# Altium schematic sheet IO_Connectors.SchDoc
size A4; SheetNumber: 2; SheetTotal: 17
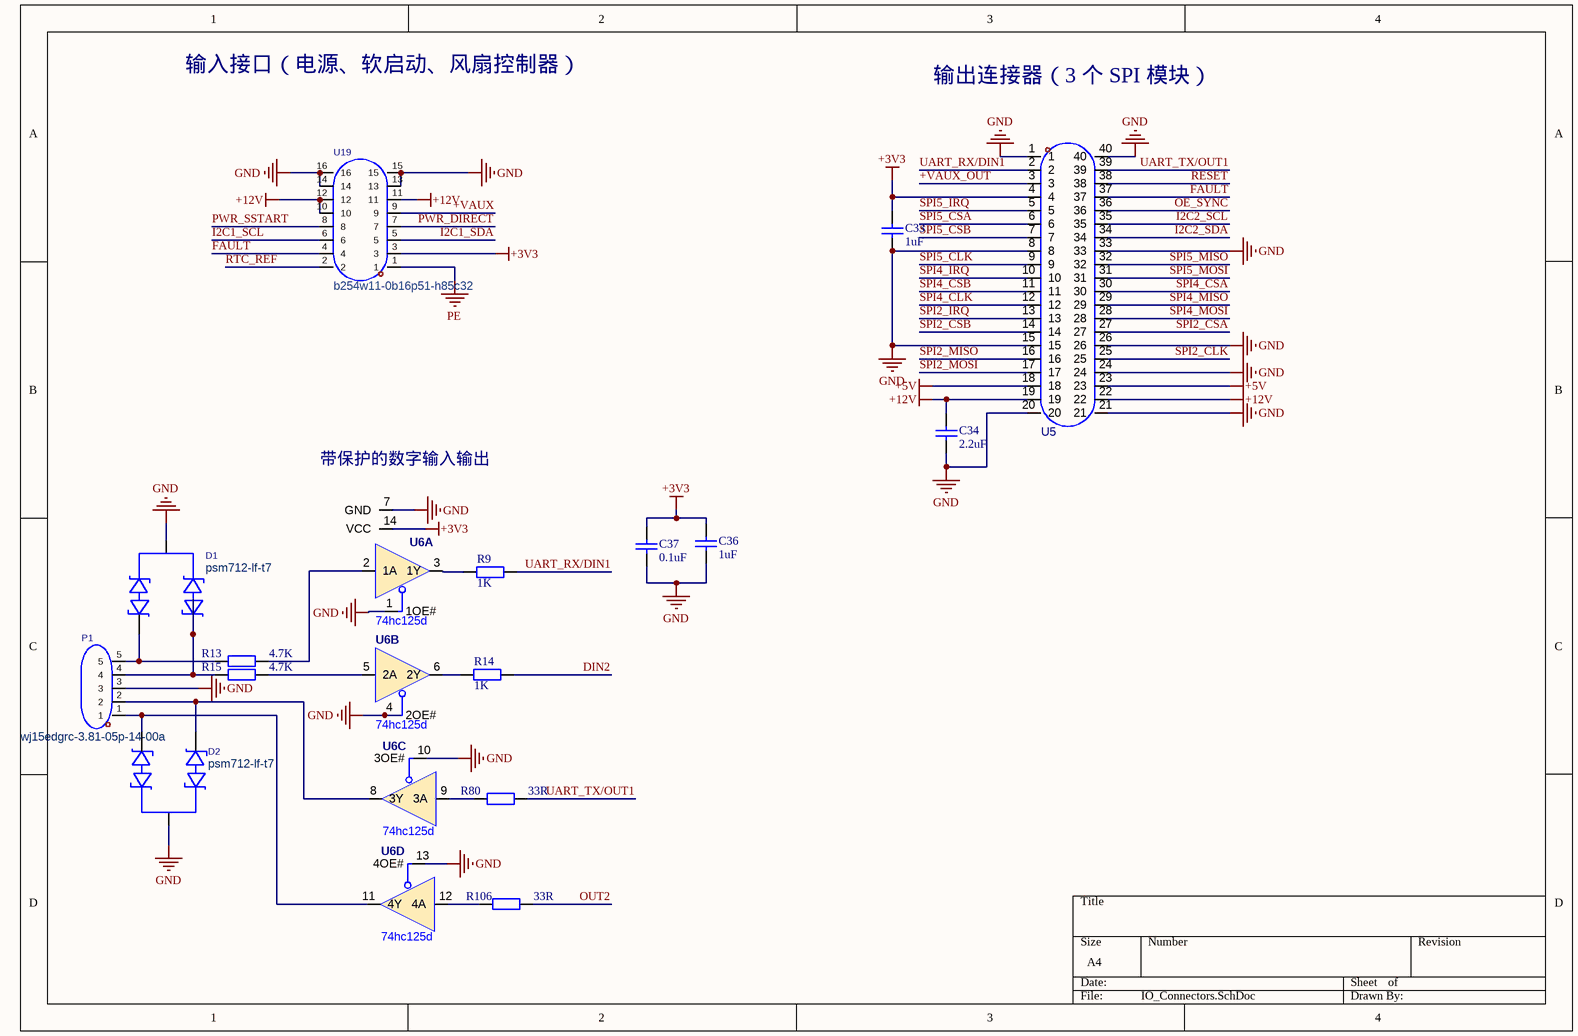
[diagram p0: IO_Connectors.SchDoc]

## Parts
C33  1uF  [C0603]
C34  2.2uF  [C0603]
C36  1uF  [C0603]
C37  0.1uF  [C0603]
D1  psm712-lf-t7  [SOT-23-3_L3.0-W1.7-P0.95-LS2.9-BR]
D2  psm712-lf-t7  [SOT-23-3_L3.0-W1.7-P0.95-LS2.9-BR]
P1  wj15edgrc-3.81-05p-14-00a  [CONN-TH_5P-P3.81_WJ15EDGRC-3.81-5P]
R9  1K  [R0603]
R13  4.7K  [R0603]
R14  1K  [R0603]
R15  4.7K  [R0603]
R80  33R  [R0603]
R106  33R  [R0603]
U5  ds1024-2x20r2  [HDR-TH_40P-P2.54-H-F-R2-C20-S2.54-W8.5]  (value not drawn)
U6  74hc125d  [SOIC-14_L8.7-W3.9-P1.27-LS6.0-BL]  (parts A,B,C,D of 4)
U19  b254w11-0b16p51-h85c32  [HDR-TH_16P-P2.54-H-F-R2-C8-W8.5]

## Nets
+3V3: C33.1 C36.2 C37.2 U5.4 U6.14(VCC) U19.3
+5V: U5.18 U5.23
+12V: C34.2 U5.19 U5.22 U19.10 U19.11 U19.12
GND: C33.2 C34.1 C36.1 C37.1 D1.3(K) D2.3(K) P1.3 U5.1 U5.8 U5.15 U5.20 U5.21 U5.24 U5.26 U5.33 U5.40 U6.1(1OE#) U6.4(2OE#) U6.7(GND) U6.10(3OE#) U6.13(4OE#) U19.13 U19.14 U19.15 U19.16
PE: U19.1
+VAUX: U19.9
+VAUX_OUT: U5.3
DIN2: R14.1
FAULT: U5.37 U19.4
I2C1_SCL: U19.6
I2C1_SDA: U19.5
I2C2_SCL: U5.35
I2C2_SDA: U5.34
OE_SYNC: U5.36
OUT2: R106.2
PWR_DIRECT: U19.7
PWR_SSTART: U19.8
RESET: U5.38
RTC_REF: U19.2
SPI2_CLK: U5.25
SPI2_CSA: U5.27
SPI2_CSB: U5.14
SPI2_IRQ: U5.13
SPI2_MISO: U5.16
SPI2_MOSI: U5.17
SPI4_CLK: U5.12
SPI4_CSA: U5.30
SPI4_CSB: U5.11
SPI4_IRQ: U5.10
SPI4_MISO: U5.29
SPI4_MOSI: U5.28
SPI5_CLK: U5.9
SPI5_CSA: U5.6
SPI5_CSB: U5.7
SPI5_IRQ: U5.5
SPI5_MISO: U5.32
SPI5_MOSI: U5.31
UART_RX/DIN1: R9.1 U5.2
UART_TX/OUT1: R80.2 U5.39
NetD1_1: D1.1(A1) P1.5 R13.1
NetD1_2: D1.2(A1) P1.4 R15.1
NetD2_1: D2.1(A1) P1.2 U6.8(3Y)
NetD2_2: D2.2(A1) P1.1 U6.11(4Y)
NetR9_2: R9.2 U6.3(1Y)
NetR13_2: R13.2 U6.2(1A)
NetR14_2: R14.2 U6.6(2Y)
NetR15_2: R15.2 U6.5(2A)
NetR80_1: R80.1 U6.9(3A)
NetR106_1: R106.1 U6.12(4A)

## Notes on the sheet
- 输入接口（电源、软启动、风扇控制器）
- 输出连接器（3 个 SPI 模块）
- (near U6) 带保护的数字输入输出

## Library data of the parts
C33 C34 C36 C37 = C0603: Capacitor; Value: 104; Published: 8-Jun-2000; LatestRevisionDate: 17-Jul-2002; LatestRevisionNote: Re-released for DXP Platform.; Publisher: Altium Limited
D1 D2 = psm712-lf-t7: 极性:单向;反向截止电压(Vrwm):12V;钳位电压:19V;峰值脉冲电流(Ipp):34A@8/20us；30A@8/20us;峰值脉冲功率(Ppp):600W@8/20us;击穿电压(VBR):13.3V;; Manufacturer: PROTEK; AddInBom: yes; ModelId: 89cb27a44ab2466697082bb9fd73a7d0; ModelName: SOT-23-3L_L2.9-W1.6-H1.1-LS2.8-P0.95; ModelTransform: 114.173,110.236,0,90,0,0,0,0,0; Polarity: 单向; Reverse Stand-Off Voltage (Vrwm): 12V; Clamping Voltage: 19V; Voltage - Breakdown: 13.3V; Reverse Leakage Current (Ir): 1uA；20uA; level of protection: IEC 61000-4-4；IEC 61000-4-5；IEC 61000-4-2; Type: TVS; Junction Capacitance: 75pF; Symbol: PSM712-LF-T7; LCSC Part Name: 单向TVS 12V截止 峰值浪涌电流：34A@8/20us 30A@8/20us; SupplierPart: C32677; ManufacturerPart: PSM712-LF-T7; Supplier Footprint: SOT-23; JLCPCB Part Class: Basic Part; Datasheet: https://item.szlcsc.com/datasheet/PSM712-LF-T7/33642.html; Supplier: LCSC; ConvertToPcb: yes; FootprintName: SOT-23-3_L3.0-W1.7-P0.95-LS2.9-BR; Peak Pulse Current (Ipp): 34A@8/20us；30A@8/20us; Peak Pulse Power Dissipation (Ppp): 600W@8/20us; Operating Temperature: -55℃~+150℃
P1 = wj15edgrc-3.81-05p-14-00a: 连接器类型:板端/插座-闭口;固定方式:无固定装置;结构:1x5P;间距:3.81mm;颜色:绿色;安装方式:弯插;排数:1;每排PIN数:5;额定电流:8A;额定电压:300V;线规 - AWG:-;线规 - 平方毫米:-;工作温度:-40℃~+105℃;; Manufacturer: KANGNEX(康奈克斯电气); Symbol: WJ15EDGRC-3.81-5P; AddInBom: yes; ModelId: 1f5bfc586d7a497a94e16b2138b9ad12; ModelName: CONN-TH_WJ3.81-WI-5P; ModelTransform: 784.64406,360.2355,0,0,0,0,-0.197,-118.11,-137.795; Number of Positions or Pins: 1x5P; Pitch: 3.81mm; Number of PINs Per Row: 5; Current Rating: 8A; Voltage Rating (Max): 300V; LCSC Part Name: 无固定装置 1x5P 3.81mm 排数:1 每排P数:5; SupplierPart: C8395; ManufacturerPart: WJ15EDGRC-3.81-05P-14-00A; Supplier Footprint: 弯插,P=3.81mm; JLCPCB Part Class: Extended Part; Datasheet: https://item.szlcsc.com/datasheet/WJ15EDGRC-3.81-05P-14-00A/8889.html; Supplier: LCSC; ConvertToPcb: yes; FootprintName: CONN-TH_5P-P3.81_WJ15EDGRC-3.81-5P; Connector Type: 板端/插座-闭口; Termination Style: 无固定装置; Color: 绿色; Mounting Type: 弯插; Number of Pins: 5P; Number of Rows: 1; Wire Gauge - AWG: -; Wire Gauge - mm2: -; Operating Temperature: -40℃~+105℃; Connection Type: -; Outlet Direction (Vertical Basis): -
R9 R13-R15 R80 R106 = R0603: Resistor; Published: 8-Jun-2000; LatestRevisionDate: 17-Jul-2002; LatestRevisionNote: Re-released for DXP Platform.; Publisher: Altium Limited
U5 = ds1024-2x20r2: 插孔结构:2x20P;间距:2.54mm;行距:2.54mm;圆孔/方孔:方孔;安装方式:弯插;排数:双排;总孔位数:40P;额定电流:3A;额定电压:250V;插孔方向:侧面;塑高:2.5mm;触头镀层:金镍;工作温度:-40℃~+105℃;; Manufacturer: CONNFLY; AddInBom: yes; ModelId: a9ccadb72efd4c37a205c7e50d3d2ca6; ModelTransform: 2023.618,499.999,0,180,0,0,0,192.917,-125.984; Holes Structure: 2x20P; Pitch: 2.54mm; Circular Hole / Square Hole: 方孔; Number of Positions: 40P; Current Rating: 3A; Voltage Rating (Max): 250V; Holes Direction: 侧面; Symbol: DS1024-2X20R2; LCSC Part Name: 黑色 2x20P 间距:2.54mm 弯插; SupplierPart: C7509545; ManufacturerPart: DS1024-2x20R2; Supplier Footprint: 弯插,P=2.54mm; JLCPCB Part Class: Extended Part; Datasheet: https://item.szlcsc.com/datasheet/DS1024-2x20R2/8601981.html; Supplier: LCSC; ConvertToPcb: yes; FootprintName: HDR-TH_40P-P2.54-H-F-R2-C20-S2.54-W8.5; ModelName: HDR-TH_40P-P2.54-H-F-R2-C20-S2.54-W8.5; Row Spacing: 2.54mm; Mounting Type: 弯插; Number of Rows: 双排; Insulation Height: 2.5mm; Contact Plating: 金镍; Operating Temperature: -40℃~+105℃
U6 = 74hc125d_c52140399: 输入类型:标准CMOS;工作电压:2V~6V;元件数:4;每个元件位数:-;灌电流(IOL):7.8mA;拉电流(IOH):7.8mA;; Manufacturer: MDD(辰达半导体); AddInBom: yes; ModelId: 8dbf5b715d42428c85558507ae5a252b; ModelName: SOIC-14_L8.6-W3.9-H1.8-LS6.0-P1.27; ModelTransform: 338.583,236.22,0,0,0,0,0,0.001,0; Input type: 标准CMOS; output type: 三态; Voltage - Supply: 2V~6V; Number of Elements: 4; Channel Type: 单向; Current - Output Low(IOL): 7.8mA; Logic Family: 74HC; Quiescent Current: 40uA; Propagation Delay: 20ns@6.0V,15pF; LCSC Part Name: 带三态输出的四路缓冲器/线路驱动器; SupplierPart: C52140399; ManufacturerPart: 74HC125D; Supplier Footprint: SOP-14L; JLCPCB Part Class: Extended Part; Datasheet: https://item.szlcsc.com/datasheet/74HC125D/54938128.html; Supplier: LCSC; ConvertToPcb: yes; SymbolName: 74HC125D_C52140399; FootprintName: SOIC-14_L8.7-W3.9-P1.27-LS6.0-BL; Number of Bits per Element: -; Current - Output High(IOH): 7.8mA; Operating Temperature: -40℃~+125℃; Features: 输出使能
U19 = b254w11-0b16p51-h85c32: 插孔结构:2x8P;间距:2.54mm;行距:2.54mm;圆孔/方孔:方孔;安装方式:弯插;排数:双排;总孔位数:16P;额定电流:3A;插孔方向:侧面;塑高:8.5mm;触头材质:黄铜;触头镀层:金;工作温度:-40℃~+105℃;; Manufacturer: JXTCONN(聚兴泰); AddInBom: yes; ModelId: 3769f9c01991404e933d2dcd4e3e6b52; ModelTransform: 823.62,499.999,0,0,0,0,0,-192.913,-125.984; Holes Structure: 2x8P; Pitch: 2.54mm; Circular Hole / Square Hole: 方孔; Number of Positions: 16P; Current Rating: 3A; Holes Direction: 侧面; PIN Length: 3.2mm; Symbol: B254W11-0B16P51-H85C32; LCSC Part Name: 插孔结构：2x8P 间距：2.54mm 安装方式：弯插 排数：双排 方孔; SupplierPart: C49297019; ManufacturerPart: B254W11-0B16P51-H85C32; Supplier Footprint: 弯插,P=2.54mm; JLCPCB Part Class: Extended Part; Datasheet: https://item.szlcsc.com/datasheet/B254W11-0B16P51-H85C32/51751274.html; Supplier: LCSC; ConvertToPcb: yes; FootprintName: HDR-TH_16P-P2.54-H-F-R2-C8-W8.5; ModelName: HDR-TH_16P-P2.54-H-F-R2-C8-W8.5; Row Spacing: 2.54mm; Mounting Type: 弯插; Number of Rows: 双排; Insulation Height: 8.5mm; Contact Material: 黄铜; Contact Plating: 金; Operating Temperature: -40℃~+105℃